# Altium schematic sheet TOP.SchDoc
size A4; SheetNumber: 1; SheetTotal: 5
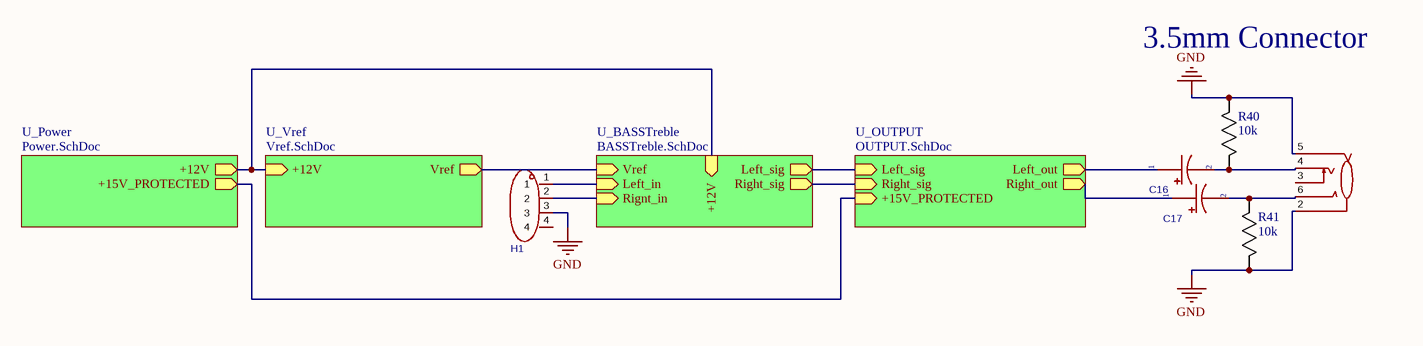
[diagram p0: TOP.SchDoc]

## Parts
C16  2200uF  [ELC CAP D=5]  (value not drawn)
C17  2200uF  [ELC CAP D=5]  (value not drawn)
CN1  pj-327a_c49284723  [3.5mm 5pin SMD]  (value not drawn)
H1  pz254r-11-04p  [4pin connector]  (value not drawn)
R40  10k  [0603 RES]
R41  10k  [0603 RES]

## Sub-sheets
U_BASSTreble = BASSTreble.SchDoc: Vref (in), Left_in (in), Rignt_in (in), Left_sig (out), Right_sig (out), +12V (in)
U_OUTPUT = OUTPUT.SchDoc: Left_sig (in), Right_sig (in), +15V_PROTECTED (in), Left_out (out), Right_out (out)
U_Power = Power.SchDoc: +12V (out), +15V_PROTECTED (out)
U_Vref = Vref.SchDoc: Vref (out), +12V (in)

## Nets
GND: CN1.2 CN1.5 H1.3 R40.1 R41.2
NetC16_1: C16.1 ; sheet U_OUTPUT/Left_out
NetC16_2: C16.2 CN1.4 R40.2
NetC17_1: C17.1 ; sheet U_OUTPUT/Right_out
NetC17_2: C17.2 CN1.6 R41.1
NetH1_1: H1.1 ; sheet U_BASSTreble/Left_in
NetH1_2: H1.2 ; sheet U_BASSTreble/Rignt_in
(unnamed): sheet U_BASSTreble/Vref, sheet U_Vref/Vref
(unnamed): sheet U_BASSTreble/Left_sig, sheet U_OUTPUT/Left_sig
(unnamed): sheet U_BASSTreble/Right_sig, sheet U_OUTPUT/Right_sig
(unnamed): sheet U_BASSTreble/+12V, sheet U_Vref/+12V, sheet U_Power/+12V
(unnamed): sheet U_Power/+15V_PROTECTED, sheet U_OUTPUT/+15V_PROTECTED

Not connected (* = marked no-connect by the designer): CN1 3; H1 4

## Notes on the sheet
- (near R40) 3.5mm Connector

## Library data of the parts
C16 C17 = CAP_ELECTROLYTIC: Tolerance:±20% Voltage Rating:25V Pin Spacing:5mm Diameter:12.5mm Height - Seated (Max):25mm Lifetime:2000hrs@105℃ Operating Temperature:-40℃~+105℃ Operating Temperature:-40℃~+105℃ Polarity type:Polarized; Manufacturer: Jianghai(南通江海); Symbol: ECR1EBK222MLL125025; AddInBom: yes; ModelId: bba5f7414a9d4a73a222d32de1544099; ModelName: CAP-TH_D12.5-H20.0-P5.00; ModelTransform: 492.5187,492.11201,0,0,0,0,0,0,-137.795; Tolerance: ±20%; Voltage Rating: 25V; Pin Spacing: 5mm; LCSC Part Name: 2200uF ±20% 25V; SupplierPart: C233102; ManufacturerPart: ECR1EBK222MLL125025; Supplier Footprint: 插件; JLCPCB Part Class: Extended Part; Datasheet: https://item.szlcsc.com/datasheet/ECR1EBK222MLL125025/232937.html; Supplier: LCSC; ConvertToPcb: yes; FootprintName: CAP-TH_BD12.5-P5.00-D0.6-FD; Value: 2200uF; Diameter: 12.5mm; Height - Seated (Max): 25mm; Lifetime: 2000hrs@105℃; Operating Temperature: -40℃~+105℃; Polarity type: Polarized
CN1 = 3.5mm 5pin SMD: Connector Type:3.5mm Headphone Jack Current Rating:500mA Voltage Rating (Max):30V Contact Material:Copper Contact Plating:Silver Operating Temperature:-25℃~+85℃ Operating Temperature:-25℃~+85℃ Rank Number:TRRS Mounting Style:Surface Mount Color:Black Body; Manufacturer: XUNPU(讯普); AddInBom: yes; ModelId: 28a3bb7a9e024b9f97707116e53a84e6; ModelName: AUDIO-SMD_XUNPU_PJ-327A; ModelTransform: 559.054,338.55094,0,0,0,0,-55.118,0,-25.591; Current Rating: 500mA; Voltage Rating (Max): 30V; Rank Number: TRRS; Body Height: 4.4mm; Symbol: PJ-327A; LCSC Part Name: 3.5mm耳机座; SupplierPart: C49284723; ManufacturerPart: PJ-327A; Supplier Footprint: SMD; JLCPCB Part Class: Extended Part; Datasheet: https://item.szlcsc.com/datasheet/PJ-327A/51736272.html; Supplier: LCSC; ConvertToPcb: yes; FootprintName: AUDIO-SMD_XUNPU_PJ-327A; Connector Type: 3.5mm Headphone Jack; Contact Material: Copper; Contact Plating: Silver; Operating Temperature: -25℃~+85℃; Mounting Style: Surface Mount; Color: Black; Length: 14.2mm; Width: 6mm
H1 = 4pin connector: Pin Structure:1x4P Pitch:2.54mm Row Spacing:- Circluar Pins/Square Pins:Pin Header Mounting Type:Right Angle Number of Rows:1 Number of Pins:4P Current Rating:3A Voltage Rating (Max):250V Length of Mating Pin:6mm Insulation Height:2.5mm Length of End Conn; Manufacturer: XFCN(兴飞); AddInBom: yes; ModelId: 13284729e4054d7b9656609df5ff9409; ModelName: HDR-TH_4P-P2.54-M-WI-1X4P; ModelTransform: 399.999,417.322,0,180,0,0,0,-196.85,-118.11; Pin Structure: 1x4P; Pitch: 2.54mm; Current Rating: 3A; Voltage Rating (Max): 250V; Symbol: PZ254R-11-04P; LCSC Part Name: 1x4P 间距:2.54mm 方针 弯插; SupplierPart: C492412; ManufacturerPart: PZ254R-11-04P; Supplier Footprint: 弯插,P=2.54mm; JLCPCB Part Class: Extended Part; Datasheet: https://item.szlcsc.com/datasheet/PZ254R-11-04P/502968.html; Supplier: LCSC; ConvertToPcb: yes; FootprintName: HDR-TH_4P-P2.54-H-M-W10.4; Row Spacing: -; Circluar Pins/Square Pins: Pin Header; Mounting Type: Right Angle; Number of Rows: 1; Number of Pins: 4P; Length of Mating Pin: 6mm; Insulation Height: 2.5mm; Length of End Connection Pin: -; Contact Material: Brass; Contact Plating: -; Operating Temperature: -40℃~+105℃; Color: Black
R40 R41 = Resistor: Manufacturer_Name: Vishay; Manufacturer_Part_Number: CRCW060310K0FKEA; Copyright: Copyright (C) 2025 Ultra Librarian. All rights reserved.